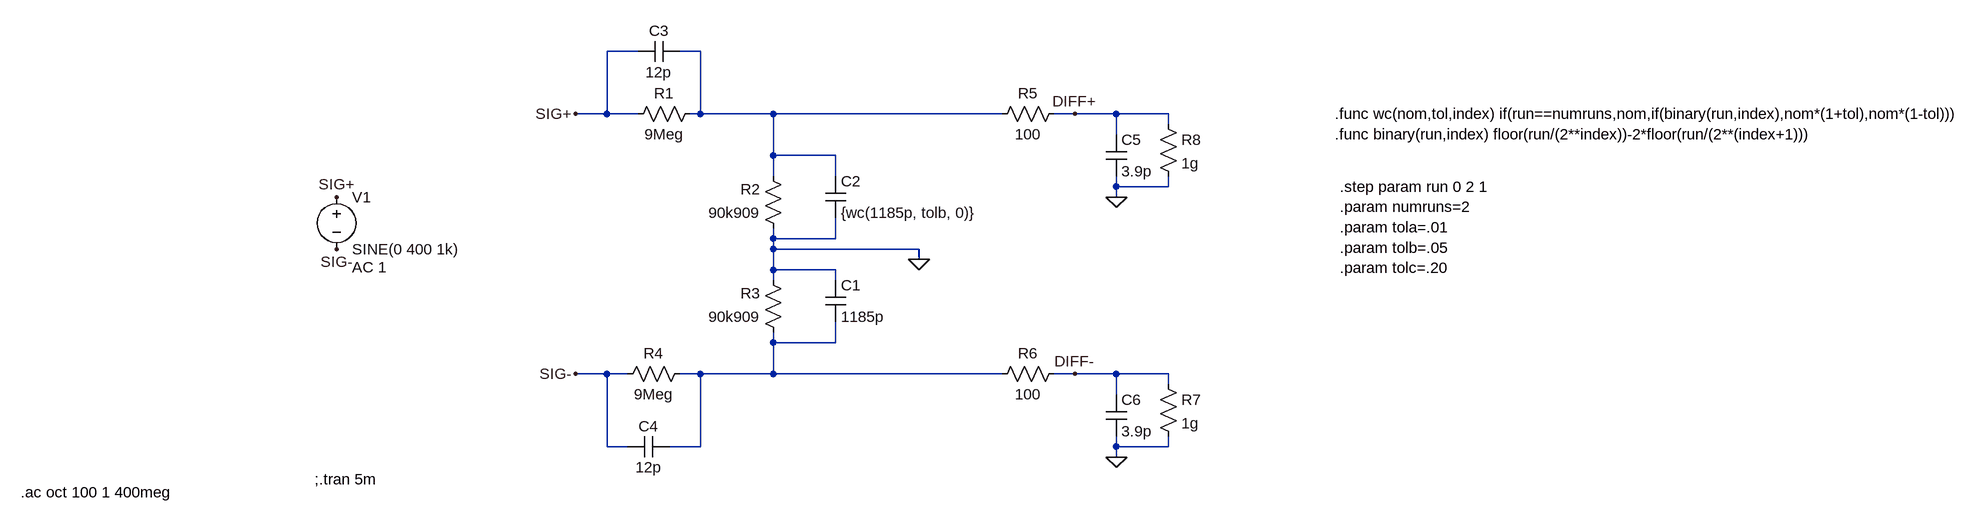
[diagram p0: schematic differential_probe.asc]
differential_probe.asc, the LTspice schematic file:
Version 4
SHEET 1 2064 712
WIRE -32 16 -80 16
WIRE 64 16 32 16
WIRE -80 112 -80 16
WIRE -80 112 -128 112
WIRE -32 112 -80 112
WIRE 64 112 64 16
WIRE 64 112 48 112
WIRE 176 112 64 112
WIRE 528 112 176 112
WIRE 640 112 608 112
WIRE 704 112 640 112
WIRE 784 112 704 112
WIRE 784 128 784 112
WIRE 704 144 704 112
WIRE 176 176 176 112
WIRE 272 176 176 176
WIRE 176 208 176 176
WIRE 272 208 272 176
WIRE 704 224 704 208
WIRE 784 224 784 208
WIRE 784 224 704 224
WIRE 704 240 704 224
WIRE 176 304 176 288
WIRE 272 304 272 272
WIRE 272 304 176 304
WIRE 176 320 176 304
WIRE 400 320 176 320
WIRE 400 336 400 320
WIRE 176 352 176 320
WIRE 272 352 176 352
WIRE 176 368 176 352
WIRE 272 368 272 352
WIRE 176 464 176 448
WIRE 272 464 272 432
WIRE 272 464 176 464
WIRE -80 512 -128 512
WIRE -48 512 -80 512
WIRE 64 512 32 512
WIRE 176 512 176 464
WIRE 176 512 64 512
WIRE 528 512 176 512
WIRE 640 512 608 512
WIRE 704 512 640 512
WIRE 784 512 704 512
WIRE 784 528 784 512
WIRE 704 544 704 512
WIRE -80 624 -80 512
WIRE -48 624 -80 624
WIRE 64 624 64 512
WIRE 64 624 16 624
WIRE 704 624 704 608
WIRE 784 624 784 608
WIRE 784 624 704 624
WIRE 704 640 704 624
FLAG 400 336 0
FLAG -128 112 SIG+
FLAG -128 512 SIG-
FLAG 640 112 DIFF+
FLAG 640 512 DIFF-
FLAG -496 240 SIG+
FLAG -496 320 SIG-
FLAG 704 640 0
FLAG 704 240 0
SYMBOL res 64 96 R90
WINDOW 0 0 56 VBottom 2
WINDOW 3 32 56 VTop 2
SYMATTR InstName R1
SYMATTR Value 9Meg
SYMBOL res 192 304 R180
WINDOW 0 36 76 Left 2
WINDOW 3 36 40 Left 2
SYMATTR InstName R2
SYMATTR Value 90k909
SYMBOL res 192 464 R180
WINDOW 0 36 76 Left 2
WINDOW 3 36 40 Left 2
SYMATTR InstName R3
SYMATTR Value 90k909
SYMBOL res -64 528 R270
WINDOW 0 32 56 VTop 2
WINDOW 3 0 56 VBottom 2
SYMATTR InstName R4
SYMATTR Value 9Meg
SYMBOL cap 256 368 R0
SYMATTR InstName C1
SYMATTR Value 1185p
SYMBOL cap 256 208 R0
SYMATTR InstName C2
SYMATTR Value {wc(1185p, tolb, 0)}
SYMBOL cap 32 0 R90
WINDOW 0 0 32 VBottom 2
WINDOW 3 32 32 VTop 2
SYMATTR InstName C3
SYMATTR Value 12p
SYMBOL cap 16 608 R90
WINDOW 0 0 32 VBottom 2
WINDOW 3 32 32 VTop 2
SYMATTR InstName C4
SYMATTR Value 12p
SYMBOL res 624 96 R90
WINDOW 0 0 56 VBottom 2
WINDOW 3 32 56 VTop 2
SYMATTR InstName R5
SYMATTR Value 100
SYMBOL res 624 496 R90
WINDOW 0 0 56 VBottom 2
WINDOW 3 32 56 VTop 2
SYMATTR InstName R6
SYMATTR Value 100
SYMBOL voltage -496 224 R0
WINDOW 123 24 124 Left 2
WINDOW 39 0 0 Left 0
SYMATTR InstName V1
SYMATTR Value SINE(0 400 1k)
SYMATTR Value2 AC 1
SYMBOL cap 688 144 R0
SYMATTR InstName C5
SYMATTR Value 3.9p
SYMBOL cap 688 544 R0
SYMATTR InstName C6
SYMATTR Value 3.9p
SYMBOL res 768 512 R0
SYMATTR InstName R7
SYMATTR Value 1g
SYMBOL res 768 112 R0
SYMATTR InstName R8
SYMATTR Value 1g
TEXT -530 674 Left 2 !;.tran 5m
TEXT -982 694 Left 2 !.ac oct 100 1 400meg
TEXT 1040 112 Left 2 !.func wc(nom,tol,index) if(run==numruns,nom,if(binary(run,index),nom*(1+tol),nom*(1-tol)))\n.func binary(run,index) floor(run/(2**index))-2*floor(run/(2**(index+1)))
TEXT 1048 224 Left 2 !.step param run 0 2 1\n.param numruns=2\n.param tola=.01\n.param tolb=.05\n.param tolc=.20

The netlist it stands for:
* differential_probe.asc
R1 N001 SIG+ 9Meg
R2 0 N001 90k909
R3 N002 0 90k909
R4 SIG- N002 9Meg
C1 0 N002 1185p
C2 N001 0 {wc(1185p, tolb, 0)}
C3 N001 SIG+ 12p
C4 N002 SIG- 12p
R5 DIFF+ N001 100
R6 DIFF- N002 100
V1 SIG+ SIG- SINE(0 400 1k) AC 1
C5 DIFF+ 0 3.9p
C6 DIFF- 0 3.9p
R7 DIFF- 0 1g
R8 DIFF+ 0 1g
;.tran 5m
.ac oct 100 1 400meg
.func wc(nom,tol,index) if(run==numruns,nom,if(binary(run,index),nom*(1+tol),nom*(1-tol)))
.func binary(run,index) floor(run/(2**index))-2*floor(run/(2**(index+1)))
.step param run 0 2 1
.param numruns=2
.param tola=.01
.param tolb=.05
.param tolc=.20
.backanno
.end